# Altium schematic sheet W5500-EVB-Pico2_V100.SchDoc: W5500-EVB-Pico2
size A3; DrawnBy: Alan; Organization: WIZnet Co., Ltd.; Address1: 5F, Humax Village; Address2: Hwangseaul-ro, Bundang-Gu; Address3: Seongnam-Si, Gyeonggi-Do; Address4: South Korea; Revision: 1.0; SheetNumber: 1; SheetTotal: 1
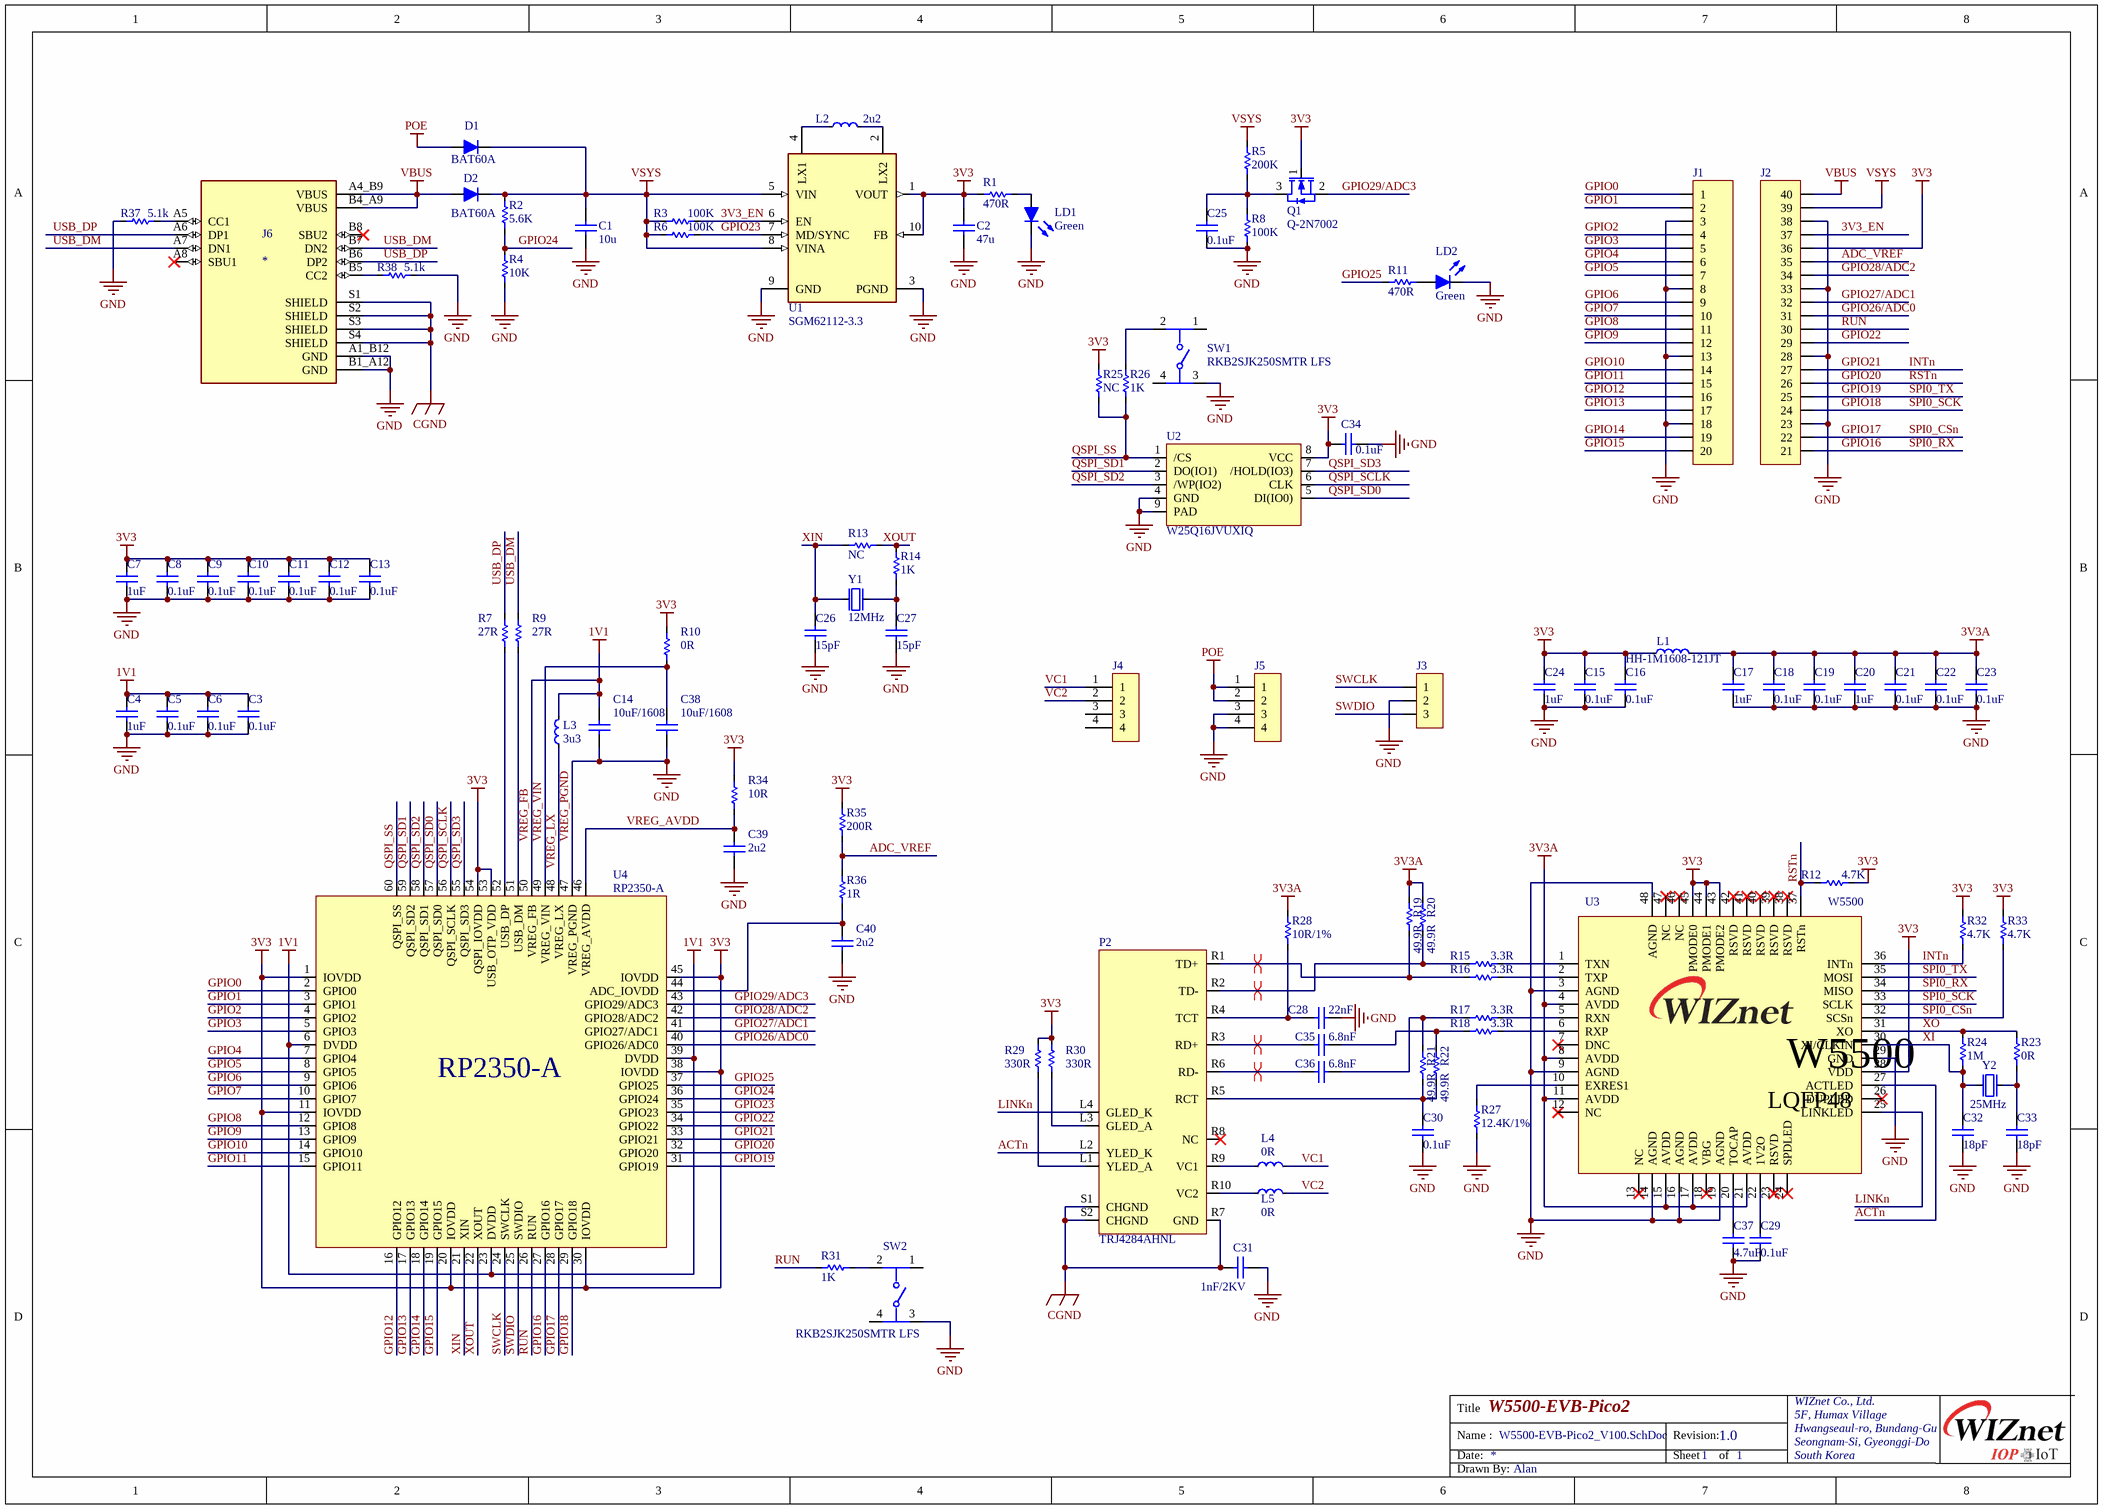
[diagram p0: W5500-EVB-Pico2_V100.SchDoc]

## Parts
C1  10u  [CAP-0805]
C2  47u  [CAP-0805]
C3  0.1uF  [CAP-0402]
C4  1uF  [CAP-0402]
C5  0.1uF  [CAP-0402]
C6  0.1uF  [CAP-0402]
C7  1uF  [CAP-0402]
C8  0.1uF  [CAP-0402]
C9  0.1uF  [CAP-0402]
C10  0.1uF  [CAP-0402]
C11  0.1uF  [CAP-0402]
C12  0.1uF  [CAP-0402]
C13  0.1uF  [CAP-0402]
C14  10uF/1608  [CAP-0603]
C15  0.1uF  [CAP-0402]
C16  0.1uF  [CAP-0402]
C17  1uF  [CAP-0402]
C18  0.1uF  [CAP-0402]
C19  0.1uF  [CAP-0402]
C20  1uF  [CAP-0402]
C21  0.1uF  [CAP-0402]
C22  0.1uF  [CAP-0402]
C23  0.1uF  [CAP-0402]
C24  1uF  [CAP-0402]
C25  0.1uF  [CAP-0402]
C26  15pF  [CAP-0402]
C27  15pF  [CAP-0402]
C28  22nF  [CAP-0402]
C29  0.1uF  [CAP-0402]
C30  0.1uF  [CAP-0402]
C31  1nF/2KV  [CAP-1808]
C32  18pF  [CAP-0402]
C33  18pF  [CAP-0402]
C34  0.1uF  [CAP-0402]
C35  6.8nF  [CAP-0402]
C36  6.8nF  [CAP-0402]
C37  4.7uF  [CAP-0805]
C38  10uF/1608  [CAP-0603]
C39  2u2  [CAP-0402]
C40  2u2  [CAP-0402]
D1  BAT60A  [SOD-323(1-C,2-A)]
D2  BAT60A  [SOD-323(1-C,2-A)]
J1  2.54mm 1x20 Pin Header DIP  [IDC-1X20]  (value not drawn)
J2  2.54mm 1x20 Pin Header DIP  [IDC-1X20]  (value not drawn)
J3  2.54mm 1x3 Pin Header DIP  [IDC-1X3]  (value not drawn)
J4  Header Socket 1x4_2.54mm  [IDC-1X4(SOCKET)]  (value not drawn)
J5  Header Socket 1x4_2.54mm  [IDC-1X4(SOCKET)]  (value not drawn)
J6  *  [USB-TYPE-C-31-M-12]
L1  HH-1M1608-121JT  [IND-0603]
L2  2u2  [IND-0805]
L3  3u3  [IND-0805]
L4  0R  [IND-0805]
L5  0R  [IND-0805]
LD1  Green  [LED-0603-RED]
LD2  Green  [LED-0603-GREEN]
P2  TRJ4284AHNL  [RB1-ZZ-0049]
Q1  Q-2N7002  [SOT23-3L]
R1  470R  [RES-0402]
R2  5.6K  [RES-0402]
R3  100K  [RES-0402]
R4  10K  [RES-0402]
R5  200K  [RES-0402]
R6  100K  [RES-0402]
R7  27R  [RES-0402]
R8  100K  [RES-0402]
R9  27R  [RES-0402]
R10  0R  [RES-0402]
R11  470R  [RES-0402]
R12  4.7K  [RES-0402]
R13  NC  [RES-0402]
R14  1K  [RES-0402]
R15  3.3R  [RES-0402]
R16  3.3R  [RES-0402]
R17  3.3R  [RES-0402]
R18  3.3R  [RES-0402]
R19  49.9R  [RES-0402]
R20  49.9R  [RES-0402]
R21  49.9R  [RES-0402]
R22  49.9R  [RES-0402]
R23  0R  [RES-0402]
R24  1M  [RES-0402]
R25  NC  [RES-0402]
R26  1K  [RES-0402]
R27  12.4K/1%  [RES-0402]
R28  10R/1%  [RES-0402]
R29  330R  [RES-0402]
R30  330R  [RES-0402]
R31  1K  [RES-0402]
R32  4.7K  [RES-0402]
R33  4.7K  [RES-0402]
R34  10R  [RES-0402]
R35  200R  [RES-0402]
R36  1R  [RES-0402]
R37  5.1k  [RES-0402]
R38  5.1k  [RES-0402]
SW1  RKB2SJK250SMTR LFS  [SW-RKB2]
SW2  RKB2SJK250SMTR LFS  [SW-RKB2]
U1  SGM62112-3.3  [SGM62112]
U2  W25Q16JVUXIQ  [SON50P300X200X60-9N]
U3  W5500  [LQFP48(0.5/9.0)]
U4  RP2350-A  [QFN60(0.4/7X7)]
Y1  12MHz  [OSC-TZ1067B]
Y2  25MHz  [OSC-82J0626]

## Nets
3V3: C2.2 C7.2 C8.2 C9.2 C10.2 C11.2 C12.2 C13.2 C15.2 C16.2 C24.2 C34.2 J2.16(36) L1.1 Q1.1(G) R1.1 R10.1 R12.2 R25.2 R29.2 R30.2 R32.1 R33.1 R34.1 R35.1 U1.1(VOUT) U1.10(FB) U2.8(VCC) U3.28(VDD) U3.43(PMODE2) U3.44(PMODE1) U3.45(PMODE0) U4.1(IOVDD) U4.11(IOVDD) U4.20(IOVDD) U4.30(IOVDD) U4.38(IOVDD) U4.45(IOVDD) U4.53(USB_OTP_VDD) U4.54(QSPI_IOVDD)
3V3A: C17.2 C18.2 C19.2 C20.2 C21.2 C22.2 C23.2 L1.2 R19.2 R20.2 R28.1 U3.4(AVDD) U3.8(AVDD) U3.11(AVDD) U3.15(AVDD) U3.17(AVDD) U3.21(AVDD)
CGND: C31.1 J6.S1(SHIELD) J6.S2(SHIELD) J6.S3(SHIELD) J6.S4(SHIELD) P2.R7(GND) P2.S1(CHGND) P2.S2(CHGND)
POE: D1.2(A) J5.1 J5.2
VBUS: D2.2(A) J2.20(40) J6.A4_B9(VBUS) J6.B4_A9(VBUS)
VREG_FB: C3.2 C4.2 C5.2 C6.2 C14.2 L3.2 U4.6(DVDD) U4.23(DVDD) U4.39(DVDD) U4.50(VREG_FB)  [also labelled 1V1]
VREG_PGND: C1.1 C2.1 C3.1 C4.1 C5.1 C6.1 C7.1 C8.1 C9.1 C10.1 C11.1 C12.1 C13.1 C14.1 C15.1 C16.1 C17.1 C18.1 C19.1 C20.1 C21.1 C22.1 C23.1 C24.1 C25.2 C26.2 C27.2 C28.1 C29.1 C30.1 C31.2 C32.1 C33.1 C34.1 C37.1 C38.1 C39.1 C40.1 J1.3 J1.8 J1.13 J1.18 J2.3(23) J2.8(28) J2.13(33) J2.18(38) J3.2 J5.3 J5.4 J6.A1_B12(GND) J6.B1_A12(GND) LD1.2(K) LD2.2(K) R4.1 R8.1 R27.2 R37.2 R38.1 SW1.3 SW2.3 U1.3(PGND) U1.9(GND) U2.4(GND) U2.9(PAD) U3.3(AGND) U3.9(AGND) U3.14(AGND) U3.16(AGND) U3.19(AGND) U3.29(GND) U3.48(AGND) U4.47(VREG_PGND) Y1.2 Y1.4 Y2.2(GND) Y2.4(GND)  [also labelled GND]
VSYS: C1.2 D1.1(K) D2.1(K) J2.19(39) R2.2 R3.1 R5.2 R6.1 U1.5(VIN) U1.8(VINA)
3V3_EN: J2.17(37) R3.2 U1.6(EN)
ACTn: P2.L2(YLED_K) U3.27(ACTLED)
ADC_VREF: J2.15(35) R35.2 R36.2
GPIO0: J1.1 U4.2(GPIO0)
GPIO1: J1.2 U4.3(GPIO1)
GPIO2: J1.4 U4.4(GPIO2)
GPIO3: J1.5 U4.5(GPIO3)
GPIO4: J1.6 U4.7(GPIO4)
GPIO5: J1.7 U4.8(GPIO5)
GPIO6: J1.9 U4.9(GPIO6)
GPIO7: J1.10 U4.10(GPIO7)
GPIO8: J1.11 U4.12(GPIO8)
GPIO9: J1.12 U4.13(GPIO9)
GPIO10: J1.14 U4.14(GPIO10)
GPIO11: J1.15 U4.15(GPIO11)
GPIO12: J1.16 U4.16(GPIO12)
GPIO13: J1.17 U4.17(GPIO13)
GPIO14: J1.19 U4.18(GPIO14)
GPIO15: J1.20 U4.19(GPIO15)
GPIO16: J2.1(21) U3.34(MISO) U4.27(GPIO16)  [also labelled SPI0_RX]
GPIO17: J2.2(22) R33.2 U3.32(SCSn) U4.28(GPIO17)  [also labelled SPI0_CSn]
GPIO18: J2.4(24) U3.33(SCLK) U4.29(GPIO18)  [also labelled SPI0_SCK]
GPIO19: J2.5(25) U3.35(MOSI) U4.31(GPIO19)  [also labelled SPI0_TX]
GPIO20: J2.6(26) R12.1 U3.37(RSTn) U4.32(GPIO20)  [also labelled RSTn]
GPIO21: J2.7(27) R32.2 U3.36(INTn) U4.33(GPIO21)  [also labelled INTn]
GPIO22: J2.9(29) U4.34(GPIO22)
GPIO23: R6.2 U1.7(MD/SYNC) U4.35(GPIO23)
GPIO24: R2.1 R4.2 U4.36(GPIO24)
GPIO25: R11.2 U4.37(GPIO25)
GPIO26/ADC0: J2.11(31) U4.40(GPIO26/ADC0)
GPIO27/ADC1: J2.12(32) U4.41(GPIO27/ADC1)
GPIO28/ADC2: J2.14(34) U4.42(GPIO28/ADC2)
GPIO29/ADC3: Q1.2(S) U4.43(GPIO29/ADC3)
LINKn: P2.L4(GLED_K) U3.25(LINKLED)
QSPI_SCLK: U2.6(CLK) U4.56(QSPI_SCLK)
QSPI_SD0: U2.5(DI(IO0)) U4.57(QSPI_SD0)
QSPI_SD1: U2.2(DO(IO1)) U4.59(QSPI_SD2)
QSPI_SD2: U2.3(/WP(IO2)) U4.58(QSPI_SD1)
QSPI_SD3: U2.7(/HOLD(IO3)) U4.55(QSPI_SD3)
QSPI_SS: R25.1 R26.1 U2.1(/CS) U4.60(QSPI_SS)
RUN: J2.10(30) R31.2 U4.26(RUN)
SWCLK: J3.1 U4.24(SWCLK)
SWDIO: J3.3 U4.25(SWDIO)
USB_DM: J6.A7(DN1) J6.B7(DN2) R9.2
USB_DP: J6.A6(DP1) J6.B6(DP2) R7.2
VC1: J4.1 L4.2
VC2: J4.2 L5.2
VREG_AVDD: C39.2 R34.2 U4.46(VREG_AVDD)
VREG_LX: L3.1 U4.48(VREG_LX)
VREG_VIN: C38.2 R10.2 U4.49(VREG_VIN)
XI: C32.2 R24.1 U3.30(XI/CLKIN) Y2.1(inp)
XIN: C26.1 R13.2 U4.21(XIN) Y1.1(inp)
XO: R23.2 R24.2 U3.31(XO)
XOUT: R13.1 R14.2 U4.22(XOUT)
NetC25_1: C25.1 Q1.3(D) R5.1 R8.2
NetC27_1: C27.1 R14.1 Y1.3(out)
NetC28_2: C28.2 P2.R4(TCT) R28.2
NetC29_2: C29.2 U3.22(1V2O)
NetC30_2: C30.2 P2.R5(RCT) R21.1 R22.1
NetC33_2: C33.2 R23.1 Y2.3(out)
NetC35_1: C35.1 R18.1 R22.2
NetC35_2: C35.2 P2.R3(RD+)
NetC36_1: C36.1 R17.1 R21.2
NetC36_2: C36.2 P2.R6(RD-)
NetC37_2: C37.2 U3.20(TOCAP)
NetC40_2: C40.2 R36.1 U4.44(ADC_IOVDD)
NetJ6_A5: J6.A5(CC1) R37.1
NetJ6_B5: J6.B5(CC2) R38.2
NetL2_1: L2.1 U1.4(LX1)
NetL2_2: L2.2 U1.2(LX2)
NetL4_1: L4.1 P2.R9(VC1)
NetL5_1: L5.1 P2.R10(VC2)
NetLD1_1: LD1.1(A) R1.2
NetLD2_1: LD2.1(A) R11.1
NetP2_L1: P2.L1(YLED_A) R29.1
NetP2_L3: P2.L3(GLED_A) R30.1
NetP2_R1: P2.R1(TD+) R16.1 R19.1
NetP2_R2: P2.R2(TD-) R15.1 R20.1
NetR7_1: R7.1 U4.52(USB_DP)
NetR9_1: R9.1 U4.51(USB_DM)
NetR15_2: R15.2 U3.1(TXN)
NetR16_2: R16.2 U3.2(TXP)
NetR17_2: R17.2 U3.5(RXN)
NetR18_2: R18.2 U3.6(RXP)
NetR26_2: R26.2 SW1.2
NetR27_1: R27.1 U3.10(EXRES1)
NetR31_1: R31.1 SW2.2

Not connected (* = marked no-connect by the designer): J4 3 4; J6 A8(SBU1)* B8(SBU2)*; P2 R8(NC)*; SW1 1 4; SW2 1 4; U3 7(DNC)* 12(NC)* 13(NC)* 18(VBG)* 23(RSVD)* 24(SPDLED)* 26(DUPLED)* 38(RSVD)* 39(RSVD)* 40(RSVD)* 41(RSVD)* 42(RSVD)* 46(NC)* 47(NC)*

## Layout directives
differential pair: NetC35_2, NetC36_2, NetP2_R1, NetP2_R2

## Notes on the sheet
- Title
- Date:
- Name :
- Revision:
- Sheet
- of
- Drawn By:
- (in symbol W5500) LQFP48

## Library data of the parts
C1 C2 = CAP-0805: MLCC-0805(2012)
C3-C13 C15-C30 C32-C36 C39 C40 = CAP-0402: Ceramic CAP 0402(1005)
C14 C38 = CAP-0603: MLCC-0603(1608)
C31 = CAP-1808: MLCC-1808(4520)
C37 = CAP-0805: Ceramic CAP 0805(2012)
D1 D2 = DIODE-BAT60A: Silicon Schottky Diode
J4 J5 = Header Socket 1x4_2.54mm: Connector; Manufacturer_Name: Harwin; Manufacturer_Part_Number: M20-7820442; Datasheet Link: https://cdn.harwin.com/pdfs/M20-782.pdf; Height: 8.65mm; Mouser Part Number: 855-M20-7820442; Mouser Price/Stock: https://www.mouser.co.uk/ProductDetail/Harwin/M20-7820442?qs=vF78I%252BjhbY9ZgDLCXkGx4w%3D%3D
J6 = TYPE-C-31-M-12: USB Connectors 24 Receptacle 1 8.94*7.3mm RoHS; MF: HRO Electronics Co., Ltd.; Price: None; Value: *; SnapEDA_Link: https://www.snapeda.com/parts/TYPE-C-31-M-12/HRO+Electronics+Co.%252C+Ltd./view-part/?ref=snap; Package: Package; Availability: Not in stock; Check_prices: https://www.snapeda.com/parts/TYPE-C-31-M-12/HRO+Electronics+Co.%252C+Ltd./view-part/?ref=eda; MP: TYPE-C-31-M-12
L1 L4 L5 = IND-0603: Inductor 0603(1608)
L2 L3 = IND-0805: Inductor 0805(2012)
LD1 LD2 = LED-0603
P2 = RB1-ZZ-0049: PoE RJ45
Q1 = Q-2N7002: N-Channel 60-V (D-S) MOSFET
R1-R6 R8 R10-R38 = RES-0402
R7 R9 = RES-0603: Chip Resistor 0603(1608); Manufacturer: Yageo; Power Rating: 100mW; Voltage Rating: 50V; Tolerance: 1%; Temperature Coefficient: 100ppm/degreesC; Resistance: 1.5KOhm; Military Standard: Not; Datasheet URL: http://www.yageo.com/NewPortal/yageodocoutput?fileName=/pdf/R-Chip/PYu-RC_Group_51_RoHS_L_5.pdf; Package Description: 2-Pin Surface Mount Device, Body 1.6 x 0.8 mm; Composition: ThickFilm; Case Code (Metric): 1608; Case/Package: 0603; Number of Terminations: 2; Depth: 0.8mm; Height: 0.022inch; Manufacturer URL: http://www.yageo.com/; Lead Free: LeadFree; Min Operating Temperature: -55degC; Max Operating Temperature: 155degC; Datasheet Version: Rev. 5, 10/2016; RoHSCompliant: true; Max Power Dissipation: 100mW; Packaging: TapeandReel; Voltage Rating (DC): 50V; Length: 0.063inch; Width: 0.031inch; Number of Pins: 2; Termination: SMD/SMT; Package Reference: 0603; Package Quantity: 1; Case Code (Imperial): 0603; REACH SVHC: NoSVHC
SW1 SW2 = CMP-10040-000001-2: RKB2 DC 12V 50 mA max. 200mΩ max. 100MΩ 250 gf, -40˚C to 90˚C; Throw Configuration: SPST; Operating Force: 160gf; Actuator Type: Standard; Voltage Rating (DC): 16V; Switch Travel: 0.15mm; Switch Function: Off-Mom; Max Current Rating: 50mA; Mechanical Life: 150000Cycles; Illumination Type: Non-Illuminated; Package Quantity: 2900; Depth: 4.6mm; Mount: Surface Mount; Packaging: Tape and Reel; Length: 3.2mm; RoHS Compliant: Yes; Case/Package: SMD/SMT; Min Operating Temperature: -40°C; Termination: J-Bend; Lead Free: Lead Free; Contact Plating: Silver; Orientation: Straight; Max Operating Temperature: 85°C; Current Rating: 50mA; Color: Black
U1 = SGM62112-3.3: Buck-Boost Switching Regulator IC Positive Adjustable 1.8V 1 Output 800mA 10-WFDFN Exposed Pad; MF: Richtek USA; MP: RT6150AGQW; Digi-Key_Part_Number: 1028-1259-1-ND; Digi-Key_Purchase_URL: https://www.digikey.com/product-detail/en/richtek-usa-inc/RT6150AGQW/1028-1259-1-ND/4733181?utm_source=snapeda&utm_medium=aggregator&utm_campaign=symbol; SnapEDA_Link: https://www.snapeda.com/parts/RT6150AGQW/Richtek%20USA%20Inc./view-part/1219544/?ref=snap; Package: WFDFN-10 Richtek; Value: *
U2 = W25Q16JVZPIM: 3V 16M-BIT / SERIAL FLASH MEMORY WITH / DUAL/QUAD SPI, QPI & DTR
U3 = W5500: WIZnet Hardwired TCP/IP Chip
U4 = RP2350-A: Raspverry Pi, ARM Cortex-M3+ @ 133MHz
Y1 = OSC-TZ1067B-12MHz: X-tal 12MHz,3.2x2.5 SMD, CL=20pF
Y2 = OSC-82J0626-25MHz: X-tal 25MHz,3.2x2.5 SMD, CL=18pF